# Altium schematic sheet clutch_interface.SchDoc
size A
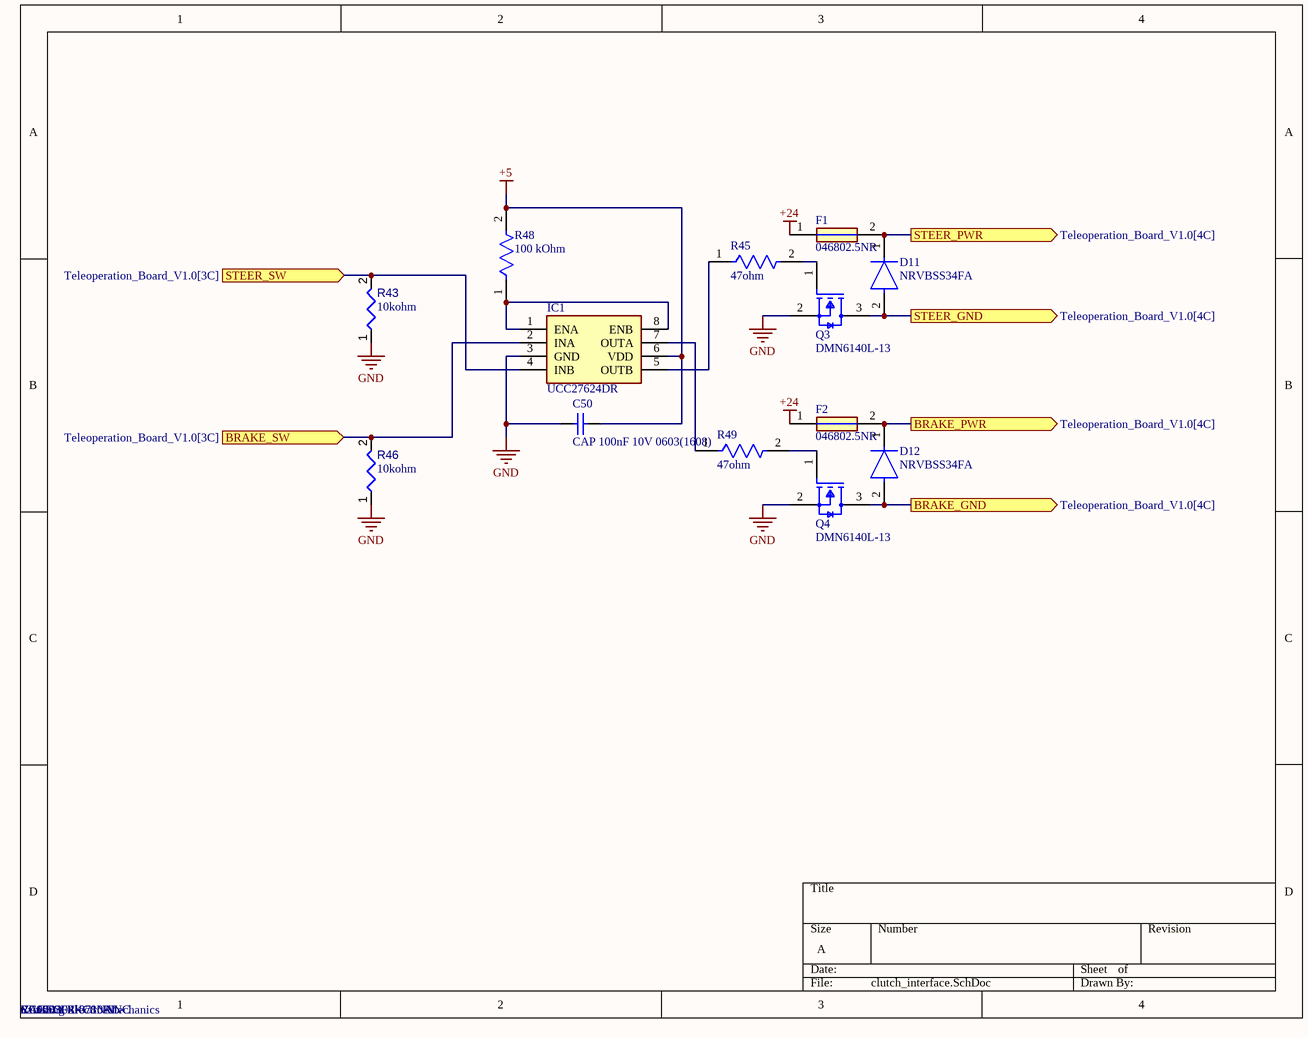
[diagram p0: clutch_interface.SchDoc]

## Parts
C50  CAP 100nF 10V 0603(1608)  Manufacturer: Samsung Electro-Mechanics  Manufacturer Part Number: CL10B104KC8NNNC  [CAPC0603(1608)100_L]
D11  NRVBSS34FA  [FP-425AB-MFG]
D12  NRVBSS34FA  [FP-425AB-MFG]
F1  046802.5NR  [FUSC3215X76N]
F2  046802.5NR  [FUSC3215X76N]
IC1  UCC27624DR  [SOIC127P600X175-8N]
Q3  DMN6140L-13  [FP-SOT23-MFG]
Q4  DMN6140L-13  [FP-SOT23-MFG]
R43  value 10kohm  Manufacturer: YAGEO  Manufacturer Part Number: RC0603FR-0710KL  [RESC1608X55X25ML10T15]  (hidden comment: Resistor 10k +/-1% 0603 100 mW)
R45  47ohm  [FP-RT0603-MFG]
R46  value 10kohm  Manufacturer: YAGEO  Manufacturer Part Number: RC0603FR-0710KL  [RESC1608X55X25ML10T15]  (hidden comment: Resistor 10k +/-1% 0603 100 mW)
R48  100 kOhm  [FP-AC0603-MFG]
R49  47ohm  [FP-RT0603-MFG]

## Ports
BRAKE_GND (out, see Teleoperation_Board_V1.0[4C]), BRAKE_PWR (out, see Teleoperation_Board_V1.0[4C]), BRAKE_SW (in, see Teleoperation_Board_V1.0[3C]), STEER_GND (out, see Teleoperation_Board_V1.0[4C]), STEER_PWR (out, see Teleoperation_Board_V1.0[4C]), STEER_SW (in, see Teleoperation_Board_V1.0[3C])

## Nets
+5: C50.2 IC1.6(VDD) R48.2
+24: F1.1 F2.1
GND: C50.1 IC1.3(GND) Q3.2(S) Q4.2(S) R43.1 R46.1
BRAKE_GND: D12.2(A) Q4.3(D) ; port BRAKE_GND
BRAKE_PWR: D12.1(C) F2.2 ; port BRAKE_PWR
BRAKE_SW: IC1.2(INA) R46.2 ; port BRAKE_SW
STEER_GND: D11.2(A) Q3.3(D) ; port STEER_GND
STEER_PWR: D11.1(C) F1.2 ; port STEER_PWR
STEER_SW: IC1.4(INB) R43.2 ; port STEER_SW
NetIC1_1: IC1.1(ENA) IC1.8(ENB) R48.1
NetIC1_5: IC1.5(OUTB) R45.1
NetIC1_7: IC1.7(OUTA) R49.1
NetQ3_1: Q3.1(G) R45.2
NetQ4_1: Q4.1(G) R49.2

## Library data of the parts
C50 = CMP-1035-02579-1: CAP 100nF 10V ±5% 0603 (1608 Metric) Thickness 1mm SMD; Tolerance: Â±5%; Case-EIA: 0603; Case-Metric: 1608; Value: 100nF; Max Thickness: 1 mm; Rated Voltage: 10 V; Technology: SMT
D11 D12 = CMP-00278-103808874-1: NRVBSS34FA Schottky Barrier Rectifier Diode 40V 3A 2-Pin SOD−123FL T/R; Manufacturer Lifecycle Status: ACTIVE; Max Junction Temperature (Tj): 125°C; Capacitance: 152pF; Peak Reverse Current: 500µA; Max Forward Surge Current (Ifsm): 80A; RoHS: Compliant; Forward Current: 3A; Height: 1.43mm; Max Operating Temperature: 125°C; Min Operating Temperature: -55°C; Lifecycle Status: Production; Max Repetitive Reverse Voltage (Vrrm): 40V; Reverse Voltage: 40V; NexarPartId: 103808874
F1 F2 = 046802.5NR: Fuse; Manufacturer_Name: LITTELFUSE; Datasheet Link: https://www.littelfuse.com/assetdocs/fuse-468-datasheet?assetguid=6b7857dc-f79c-4aae-8bcc-a9ef11ddef09; Height: 0.762mm; Manufacturer_Part_Number: 046802.5NR; Mouser Part Number: 576-046802.5NR; Mouser Price/Stock: https://www.mouser.co.uk/ProductDetail/Littelfuse/046802.5NR?qs=lHGCbWr7UNKmLbgT05TGjg%3D%3D; Arrow Part Number: 046802.5NR; Arrow Price/Stock: https://www.arrow.com/en/products/046802.5nr/littelfuse?region=nac
IC1 = UCC27624DR: Integrated Circuit; Manufacturer_Name: Texas Instruments; Datasheet Link: https://www.ti.com/lit/ds/symlink/ucc27624.pdf?ts=1654150888910&ref_url=https%253A%252F%252Fwww.ti.com%252Fproduct%252FUCC27624; Height: 1.75mm; Manufacturer_Part_Number: UCC27624DR; Mouser Part Number: 595-UCC27624DR; Mouser Price/Stock: https://www.mouser.co.uk/ProductDetail/Texas-Instruments/UCC27624DR?qs=Rp5uXu7WBW%2FHvRoPIZ55DQ%3D%3D; Arrow Part Number: UCC27624DR; Arrow Price/Stock: https://www.arrow.com/en/products/ucc27624dr/texas-instruments?utm_currency=USD&region=nac
Q3 Q4 = CMP-12801-000047-1: MOSFET N-CH 60V 1.6A SOT23; Manufacturer: Diodes Inc.; Turn Off Delay Time: 16.3ns; Power Dissipation: 0.7W; Pulse Drain Current: 10A; Number Of Channels: 1; Reverse Recovery Time: 16.8ns; Typ Forward Diode Voltage: 0.75V; Gate To Source Voltage: 20V; Rthja Max: 183°C/W; Gate Charge At Vgs: 8.6nC @ 10V; Drain To Source Resistance: 92mΩ; Depletion Mode: False; Max Junction Temp: +150°C; Max Forward Diode Voltage: 1V; Reverse Recovery Charge: 9nC; Input Capacitace At Vds: 315pF @ 40V; Standoff Height: 0.013mm; Threshold Vgs Max: 3V; Turn On Delay Time: 2.6ns; Mouser Description: MOSFET 31V to 99V N-Ch FET 60Vds 20Vgs 2.3A; ComponentLink2Description: Datasheet; Digikey Description: MOSFET N-CH 60V 1.6A SOT23; Lead Free: Yes; Category: Trans; Device Class L3: MOSFETs; Temperature Range High: +150°C; Octopart: https://octopart.com/dmn6140l-13-diodes+inc.-38898616; Drain To Source Voltage: 60V; ComponentLink2URL: https://www.diodes.com/assets/Datasheets/DMN6140L.pdf; Drain To Source Breakdown Voltage: 60V; Footprint Url: https://www.diodes.com/assets/Package-Files/SOT23.pdf; Package: SOT23; Continuous Drain Current: 1.6A; Device Class L1: Discrete Semiconductors; Device Class L2: Transistors; Number Of N Channels: 1; Temperature Range Low: -55°C; Height: 1.1mm; Manufacturer Part Number: DMN6140L-13; RoHS: TRUE; Temperature: -55°C to +150°C; Threshold Vgs Min: 1V; Automotive: No
R43 R46 = CMP-009-00017-5: Chip Resistor, 10 KOhm, +/- 1%, 01 W, -55 to 155 degC, 0603 (1608 Metric); Voltage Rating: 50V; Power: 100mW; RoHS Compliant: True; Min Operating Temperature: -55°C; Pins: 2; Case/Package: 0603; Mounting Technology: SM; Max Operating Temperature: 155°C; Tolerance: 1%
R45 R49 = CMP-03412-032644-1: RES SMD 47 OHM 1% 1/10W 0603; Manufacturer: Yageo; Manufacturer Part Number: RT0603FRE0747RL; Power Rating: 0.1W; Value: 47Ω; Temperature Coefficient: 50 ppm/°C; Tolerance: 0.01; Voltage Rating: 75V; Device Class L2: Resistors; Octopart: https://octopart.com/rt0603fre0747rl-yageo-39813773; Ipc Land Pattern Name: RESC16080X45; Automotive: No; Footprint Url: http://www.yageo.com/exep/pages/download/literatures/PYu-R_Mount_10.pdf; Package: RT0603; Lead Free: Yes; Category: Res; Device Class L1: Passive Components; Series: RT; ComponentLink2Description: Datasheet; Temperature: -55°C to +155°C; Height: 0.55mm; Digikey Description: RES SMD 47 OHM 1% 1/10W 0603; Device Class L3: Chip SMD Resistors; Temperature Range Low: -55°C; ComponentLink2URL: http://www.yageo.com/documents/recent/PYu-RT_1-to-0.01_RoHS_L_9.pdf; Mouser Description: RT Series 0603 0.1 W 47 Ohm ±1 % ±50 ppm/°C SMT Thin Film Chip Resistor; RoHS: TRUE; Temperature Range High: +155°C; Composition: Thin Film; Resistance: 47Ω
R48 = CMP-03412-022575-2: RES 100KΩ 1.00% 0.1W 0603; Tolerance: 1%; Resistance: 100kR; RoHS Compliant: Yes; Case/Package: 0603